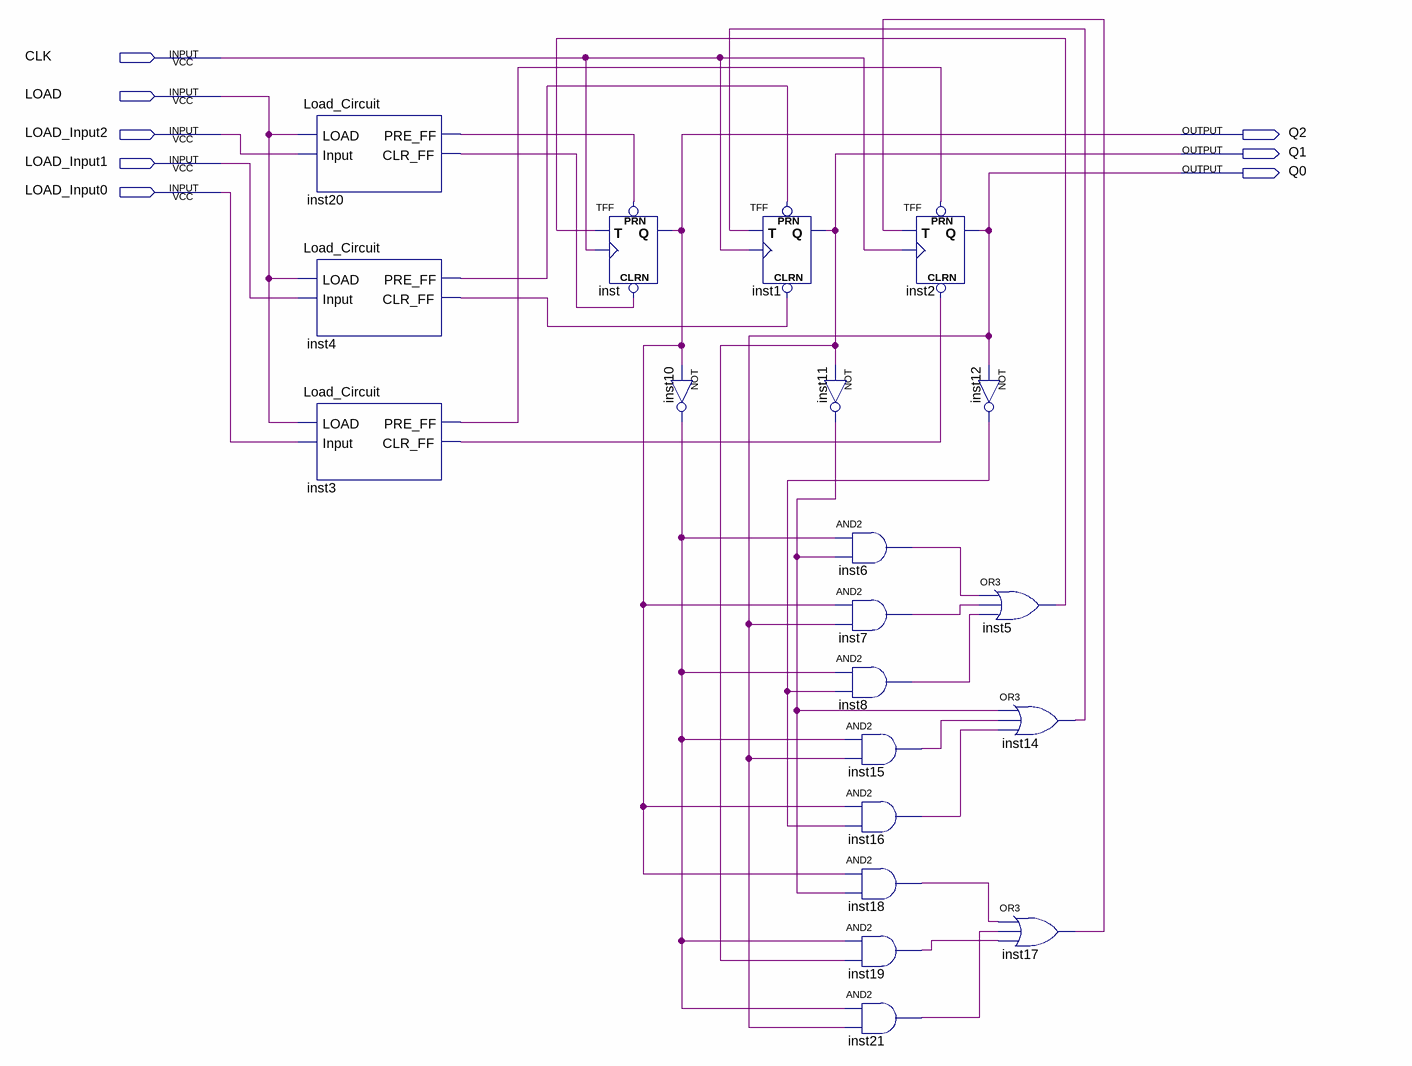
[diagram p0: schematic sheet]
// Quartus schematic cau01.bdf as structural Verilog: 20 symbols, 8 pins
module cau01 (
  input  CLK,
  input  LOAD,
  input  LOAD_Input2,
  input  LOAD_Input1,
  input  LOAD_Input0,
  output Q2,
  output Q1,
  output Q0
);

  wire inst3_clr_ff, inst3_pre_ff, inst4_clr_ff, inst4_pre_ff, inst5_out, inst6_out, inst7_out, inst8_out,
       inst10_out, inst11_out, inst12_out, inst14_out, inst15_out, inst16_out, inst17_out, inst18_out,
       inst19_out, inst20_clr_ff, inst20_pre_ff, inst21_out;

  Load_Circuit inst20 (.LOAD(LOAD), .Input(LOAD_Input2), .PRE_FF(inst20_pre_ff), .CLR_FF(inst20_clr_ff));
  Load_Circuit inst4 (.LOAD(LOAD), .Input(LOAD_Input1), .PRE_FF(inst4_pre_ff), .CLR_FF(inst4_clr_ff));
  Load_Circuit inst3 (.LOAD(LOAD), .Input(LOAD_Input0), .PRE_FF(inst3_pre_ff), .CLR_FF(inst3_clr_ff));
  TFF inst (.PRN(inst20_pre_ff), .CLRN(inst20_clr_ff), .T(inst5_out), .CLK(CLK), .Q(Q2));
  not inst10 (inst10_out, Q2);
  TFF inst1 (.PRN(inst4_pre_ff), .CLRN(inst4_clr_ff), .T(inst14_out), .CLK(CLK), .Q(Q1));
  not inst11 (inst11_out, Q1);
  and inst6 (inst6_out, inst10_out, inst11_out);
  and inst7 (inst7_out, Q2, Q0);
  and inst8 (inst8_out, inst10_out, inst12_out);
  and inst15 (inst15_out, inst10_out, Q0);
  and inst16 (inst16_out, Q2, inst12_out);
  and inst18 (inst18_out, Q2, inst11_out);
  and inst19 (inst19_out, inst10_out, Q1);
  and inst21 (inst21_out, inst10_out, Q0);
  TFF inst2 (.PRN(inst3_pre_ff), .CLRN(inst3_clr_ff), .T(inst17_out), .CLK(CLK), .Q(Q0));
  not inst12 (inst12_out, Q0);
  or inst5 (inst5_out, inst6_out, inst7_out, inst8_out);
  or inst14 (inst14_out, inst11_out, inst15_out, inst16_out);
  or inst17 (inst17_out, inst18_out, inst21_out, inst19_out);
endmodule
